# Altium project AthletiTech_V1.0.PrjPcb (part 4 of 4)

## Sheet GPS_Sheet.SchDoc
size 420 x 297 mm; SheetNumber: 5; SheetTotal: 5
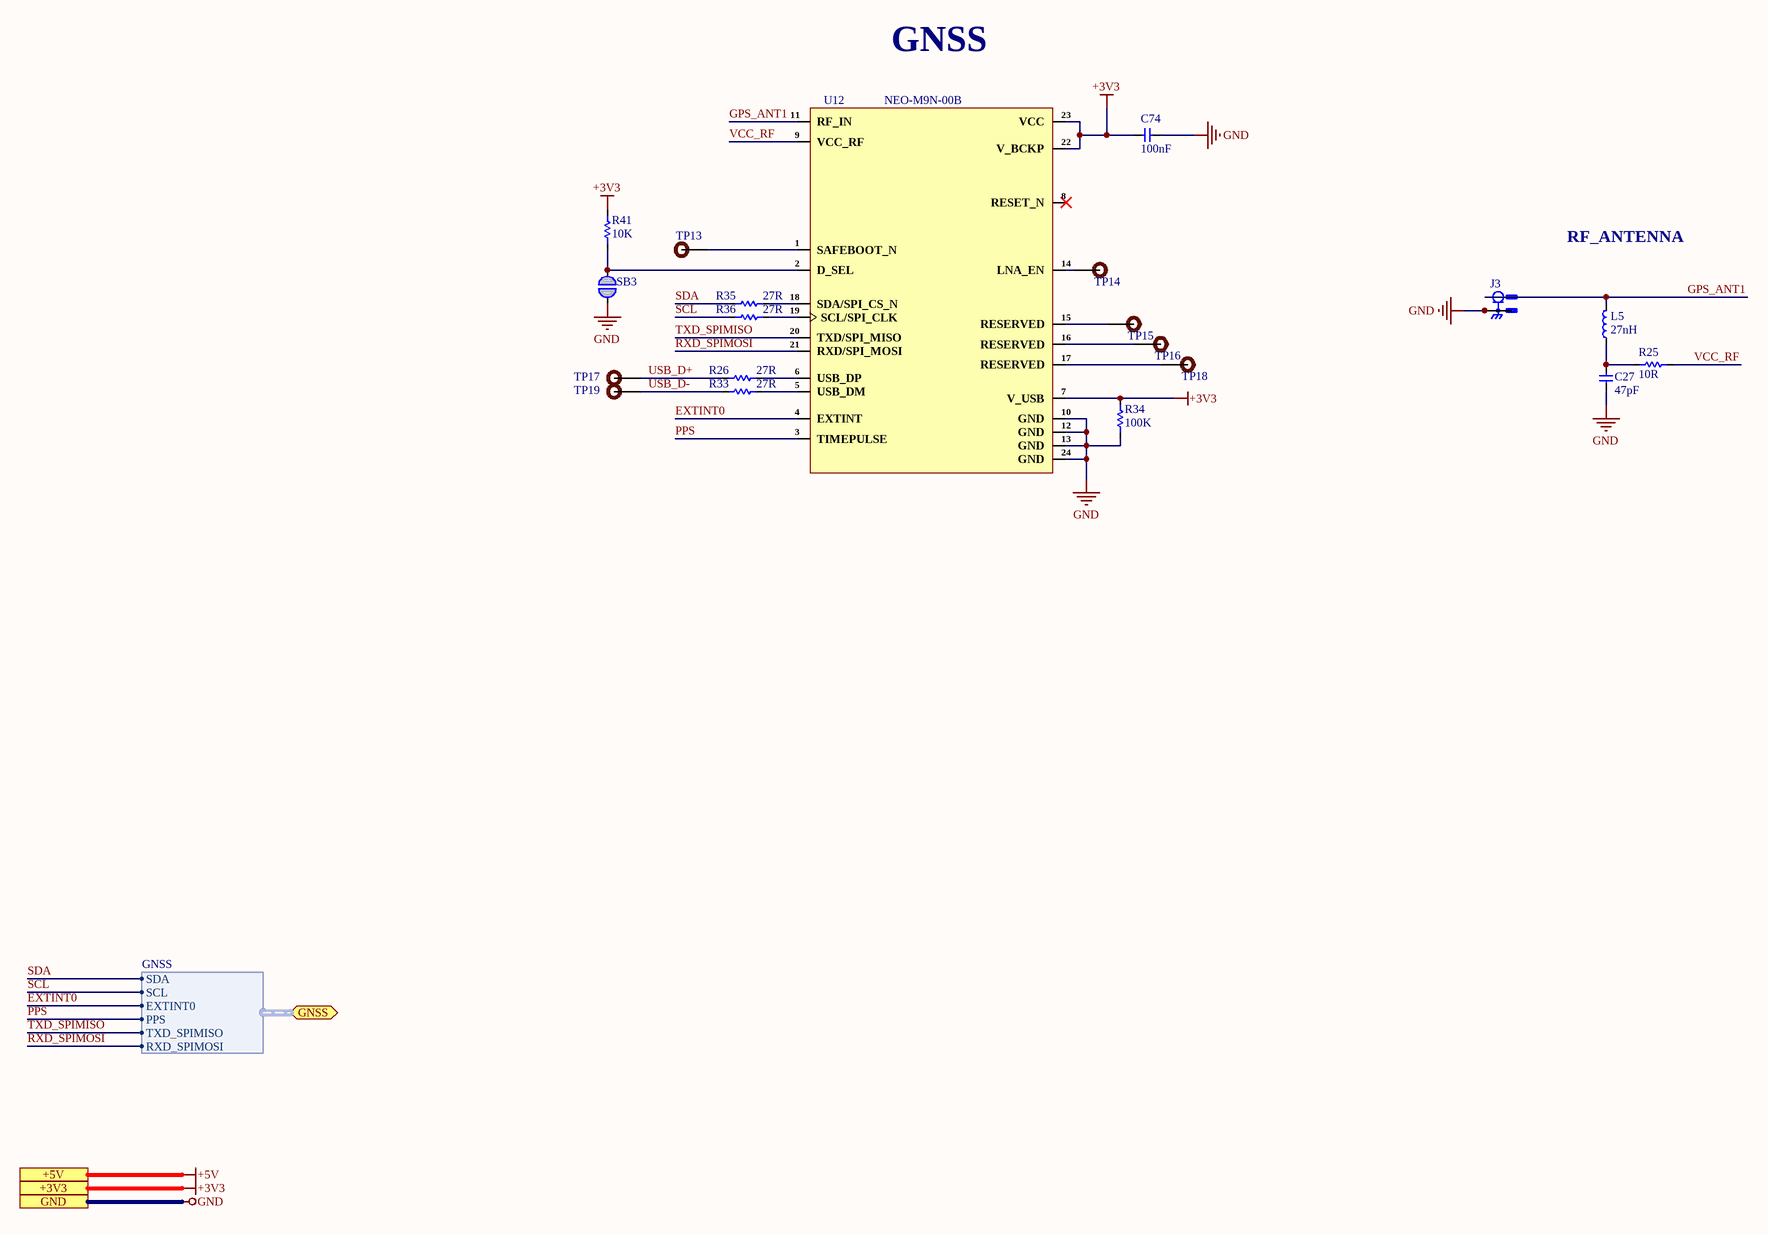
[diagram p4: GPS_Sheet.SchDoc]

### Parts
C27  47pF  [Cap-0603]
C74  100nF  [cap-0402]
J3  CONMHF4-SMD-G-T  [CONMHF4-SMD-G-T]  (value not drawn)
L5  27nH  [IND-0402]
R25  10R  [Res-0603]
R26  27R  [Res-0402]
R33  27R  [Res-0402]
R34  100K  [Res-0603]
R35  27R  [Res-0402]
R36  27R  [Res-0402]
R41  10K  [Res-0603]
SB3  Solder Bridge 0603  [Solder Bridge]  (value not drawn)  (no BOM)
TP13  TEST POINT 0.5mm Dia  [Test-point - 0.5mm]  (value not drawn)  (no BOM)
TP14  TEST POINT 0.5mm Dia  [Test-point - 0.5mm]  (value not drawn)  (no BOM)
TP15  TEST POINT 0.5mm Dia  [Test-point - 0.5mm]  (value not drawn)  (no BOM)
TP16  TEST POINT 0.5mm Dia  [Test-point - 0.5mm]  (value not drawn)  (no BOM)
TP17  TEST POINT 0.5mm Dia  [Test-point - 0.5mm]  (value not drawn)  (no BOM)
TP18  TEST POINT 0.5mm Dia  [Test-point - 0.5mm]  (value not drawn)  (no BOM)
TP19  TEST POINT 0.5mm Dia  [Test-point - 0.5mm]  (value not drawn)  (no BOM)
U12  NEO-M9N-00B  [NEO-M9N-00B]

### Ports
+3V3, +5V, GND, GNSS (bidir, harness GNSS)

### Harnesses
GNSS: SDA, SCL, EXTINT0, PPS, TXD_SPIMISO, RXD_SPIMOSI

### Nets
+3V3: C74.2 R34.2 R41.2 U12.7(V_USB) U12.22(V_BCKP) U12.23(VCC) ; port +3V3  [project net VDDAON]
GND: C27.1 C74.1 J3.S1 J3.S2 J3.S3 R34.1 SB3.2 U12.10(GND) U12.12(GND) U12.13(GND) U12.24(GND) ; port GND
EXTINT0: U12.4(EXTINT) ; port GNSS.EXTINT0
GPS_ANT1: J3.1 L5.2 U12.11(RF_IN)
PPS: U12.3(TIMEPULSE) ; port GNSS.PPS
RXD_SPIMOSI: U12.21(RXD/SPI_MOSI) ; port GNSS.RXD_SPIMOSI
SCL: R36.1 ; port GNSS.SCL
SDA: R35.1 ; port GNSS.SDA
TXD_SPIMISO: U12.20(TXD/SPI_MISO) ; port GNSS.TXD_SPIMISO
USB_D+: R26.1 TP17.1
USB_D-: R33.1 TP19.1
VCC_RF: R25.2 U12.9(VCC_RF)
NetC27_2: C27.2 L5.1 R25.1
NetR26_2: R26.2 U12.6(USB_DP)
NetR33_2: R33.2 U12.5(USB_DM)
NetR35_2: R35.2 U12.18(SDA/SPI_CS_N)
NetR36_2: R36.2 U12.19(SCL/SPI_CLK)
NetR41_1: R41.1 SB3.1 U12.2(D_SEL)
NetTP13_1: TP13.1 U12.1(SAFEBOOT_N)
NetTP14_1: TP14.1 U12.14(LNA_EN)
NetTP15_1: TP15.1 U12.15(RESERVED)
NetTP16_1: TP16.1 U12.16(RESERVED)
NetTP18_1: TP18.1 U12.17(RESERVED)

Not connected (* = marked no-connect by the designer): U12 8(RESET_N)*

### Notes on the sheet
- GNSS
- RF_ANTENNA
- File:
- Title:
- Date:
- Page
- Num:
- Total:
- Drawn By: Huzaifa Ali

### Library data of the parts
C27 = CC0603FRNPO9BN470: CAP CER 47PF 50V NPO 0603; Manufacturer: Yageo; Item Type: Capacitor; Supplier: Digikey; LCSC Part Number: C519486; Manufacturer Part Number: CC0603FRNPO9BN470; RoHS: Yes; Stock: 37282; Pricing: 1=0.19, 10=0.126, 50=0.0756, 100=0.0594, 500=0.0439, 1000=0.03634 (USD); ComponentLink1URL: https://datasheet.ciiva.com/5425/upy-gp-np0-16v-to-50v-8-5425545.pdf?src-supplier=Mouser; ComponentLink1Description: https://datasheet.ciiva.com/5425/upy-gp-np0-16v-to-50v-8-5425545.pdf?src-supplier=Mouser; ComponentLink2URL: https://datasheet.ciiva.com/11586/upy-gp-np0-16v-to-50v-8-11586472.pdf?src-supplier=Avnet; ComponentLink2Description: https://datasheet.ciiva.com/11586/upy-gp-np0-16v-to-50v-8-11586472.pdf?src-supplier=Avnet
C74 = C1005X7R1H104KT000F: CAP CER 0.1UF 50V X7R 0402; Manufacturer: TDK; Tolerance: 10%; Voltage: 25V; Item Type: Capacitor; Supplier 1: Avnet; Manufacturer Part Number: C1005X7R1H104KT000F; RoHS: No; Category: Ceramic Capacitors; Dielectric: X7R; Supplier Part Number 1: C1005X7R1H104KT000F; LCSC Part Number: C361198; ComponentLink1Description: LCSC; ComponentLink1URL: https://www.lcsc.com/product-detail/Multilayer-Ceramic-Capacitors-MLCC-SMD-SMT_TDK-C1005X7R1H104KT000F_C361198.html
J3 = CONMHF4-SMD-G-T: CONN MHF4 JACK STR SMD; Manufacturer: TE Connectivity; Item Type: Connectors; Number of Positions: 1; Supplier: Mouser; Supplier Part Number: 712-CONMHF4-SMD-G-T; Manufacturer Part Number: CONMHF4-SMD-G-T; RoHS: No; Stock: 14009; Pricing: 1=0.35, 10=0.35, 50=0.35, 100=0.345, 1000=0.26, 10000=0.26 (USD)
L5 = LQG15HZ27NH02D: FIXED IND 27NH 350MA 460MOHM SMD; Manufacturer: Murata; Core Material: Air; Tolerance: 3%; Shielding: Unshielded; DC Resistance (DCR): 460mR; Self Resonant Frequency: 1.7GHz; Test Frequency: 100MHz; Item Type: Inductor; Supplier: Mouser; Supplier Part Number: 81-LQG15HZ27NH02D; Manufacturer Part Number: LQG15HZ27NH02D; RoHS: Yes; Category: Fixed Inductors; Stock: 436; Pricing: 1=0.1, 10=0.068, 50=0.068, 100=0.047, 1000=0.03, 10000=0.026 (USD); Mounting Technology: Surface Mount; Case/Package: 0402; Case Code (Imperial): 0402; Case Code (Metric): 1005; Min Operating Temperature: -55°C; Max Operating Temperature: 125°C; Packaging: Cut Tape; Value: 27nH; Current Rating: 350mA; Series: LQG15; Ratings: AEC-Q200; RoHS Compliant: Yes; ComponentLink1URL: http://search.murata.co.jp/Ceramy/image/img/P02/JELF243B-9110.pdf?src-supplier=Digi-Key; ComponentLink1Description: http://search.murata.co.jp/Ceramy/image/img/P02/JELF243B-9110.pdf?src-supplier=Digi-Key; LCSC Part Number: C237452
R25 = RC0603FR-0710RL: RES SMD 10 OHM 1% 1/10W 0603; Manufacturer: Yageo; Temperature Coefficient: 200ppm/°C; Power Rating: 100mW; Voltage Rating: 50V; Item type: Resistor; Supplier 1: Digi-Key; Manufacturer Part Number: RC0603FR-0710RL; Stock 1: 10836596; Pricing 1: 1=0.1, 10=0.046, 100=0.0187, 1000=0.0084, 2500=0.00729 (USD); Case/Package: 0603; Number of Pins: 2; Case Code (Imperial): 0603; Case Code (Metric): 1608; Contact Plating: Tin,Matte; Min Operating Temperature: -55°C; Max Operating Temperature: 155°C; Resistance: 10R; Tolerance: 1%; Composition: Thick Film; Packaging: Tape and Reel; Voltage Rating (DC): 50V; Termination: SMD/SMT; Military Standard: Not; Length: 1.6mm; Height: 0.45mm; Width: 0.8mm; Depth: 0.8mm; Radiation Hardening: No; Lead Free: Lead Free; REACH SVHC: No SVHC; ComponentLink1URL: http://www.farnell.com/datasheets/1868787.pdf?src-supplier=Element14; ComponentLink1Description: http://www.farnell.com/datasheets/1868787.pdf?src-supplier=Element14; ComponentLink2URL: http://www.yageo.com/documents/recent/PYu-RC0603_51_RoHS_L_4.pdf?src-supplier=Avnet; ComponentLink2Description: http://www.yageo.com/documents/recent/PYu-RC0603_51_RoHS_L_4.pdf?src-supplier=Avnet; ComponentLink3URL: http://documents.rs-components.com/techlib://itc_doclist_GB.htm?stockno=5048984&src-supplier=RSComponents; ComponentLink3Description: http://documents.rs-components.com/techlib://itc_doclist_GB.htm?stockno=5048984&src-supplier=RSComponents; ComponentLink4URL: http://www.yageo.com/documents/recent/PYu-RC0603_51_RoHS_L_4.pdf?src-supplier=Avnet+Europe; ComponentLink4Description: http://www.yageo.com/documents/recent/PYu-RC0603_51_RoHS_L_4.pdf?src-supplier=Avnet+Europe; Supplier Part Number 1: 311-10.0HRDKR-ND; LCSC Part Number: C109318
R26 R33 R35 R36 = CRGCQ0402F27R: SMD Chip Resistor, 27 Ohm, ± 1%, 63 mW, 0402 [1005 Metric], Thick Film, General Purpose; Manufacturer: TE Connectivity; Operating Supply Voltage: 50V; Power Rating: 62.5mW; Supplier: Digikey; Supplier Part Number: A129608CT-ND; Manufacturer Part Number: CRGCQ0402F27R; RoHS: Yes; Category: Chip SMD Resistors; Stock: 81404; Pricing: 1=0.1, 10=0.02, 50=0.0126, 100=0.0105, 500=0.00708, 1000=0.00609, 5000=0.00442 (USD); Voltage Rating: 50V; Voltage Rating (DC): 50V; Height: 400um; ComponentLink1URL: http://datasheet.octopart.com/CRGCQ0402F27R-TE-Connectivity-datasheet-114679081.pdf?src-supplier=Farnell; ComponentLink1Description: http://datasheet.octopart.com/CRGCQ0402F27R-TE-Connectivity-datasheet-114679081.pdf?src-supplier=Farnell; ComponentLink2URL: http://datasheet.octopart.com/CRGCQ0402F27R-TE-Connectivity-datasheet-114679081.pdf?src-supplier=Mouser; ComponentLink2Description: http://datasheet.octopart.com/CRGCQ0402F27R-TE-Connectivity-datasheet-114679081.pdf?src-supplier=Mouser; ComponentLink3URL: http://datasheet.octopart.com/CRGCQ0402F27R-TE-Connectivity-datasheet-114679081.pdf?src-supplier=Avnet; ComponentLink3Description: http://datasheet.octopart.com/CRGCQ0402F27R-TE-Connectivity-datasheet-114679081.pdf?src-supplier=Avnet; ComponentLink4URL: https://www.te.com/commerce/DocumentDelivery/DDEController?Action=srchrtrv&amp;DocNm=1773204-3&amp;DocType=DS&amp;DocLang=English&src-supplier=Digikey; ComponentLink4Description: https://www.te.com/commerce/DocumentDelivery/DDEController?Action=srchrtrv&amp;DocNm=1773204-3&amp;DocType=DS&amp;DocLang=English&src-supplier=Digikey; ComponentLink5URL: http://datasheet.octopart.com/CRGCQ0402F27R-TE-Connectivity-datasheet-114679081.pdf?src-supplier=Digikey; ComponentLink5Description: http://datasheet.octopart.com/CRGCQ0402F27R-TE-Connectivity-datasheet-114679081.pdf?src-supplier=Digikey; ComponentLink6URL: http://datasheet.octopart.com/CRGCQ0402F27R-TE-Connectivity-datasheet-114679081.pdf?src-supplier=Newark; ComponentLink6Description: http://datasheet.octopart.com/CRGCQ0402F27R-TE-Connectivity-datasheet-114679081.pdf?src-supplier=Newark; ComponentLink7URL: http://datasheet.octopart.com/CRGCQ0402F27R-TE-Connectivity-datasheet-114679081.pdf?src-supplier=Verical; ComponentLink7Description: http://datasheet.octopart.com/CRGCQ0402F27R-TE-Connectivity-datasheet-114679081.pdf?src-supplier=Verical; ComponentLink8URL: http://datasheet.octopart.com/CRGCQ0402F27R-TE-Connectivity-datasheet-114679081.pdf?src-supplier=Arrow+Electronics; ComponentLink8Description: http://datasheet.octopart.com/CRGCQ0402F27R-TE-Connectivity-datasheet-114679081.pdf?src-supplier=Arrow+Electronics; ComponentLink9URL: http://datasheet.octopart.com/CRGCQ0402F27R-TE-Connectivity-datasheet-114679081.pdf?src-supplier=Onlinecomponents.com; ComponentLink9Description: http://datasheet.octopart.com/CRGCQ0402F27R-TE-Connectivity-datasheet-114679081.pdf?src-supplier=Onlinecomponents.com; ComponentLink10URL: http://datasheet.octopart.com/CRGCQ0402F27R-TE-Connectivity-datasheet-114679081.pdf?src-supplier=Sager+Electronics; ComponentLink10Description: http://datasheet.octopart.com/CRGCQ0402F27R-TE-Connectivity-datasheet-114679081.pdf?src-supplier=Sager+Electronics; ComponentLink11URL: http://datasheet.octopart.com/CRGCQ0402F27R-TE-Connectivity-datasheet-114679081.pdf?src-supplier=Electro+Sonic; ComponentLink11Description: http://datasheet.octopart.com/CRGCQ0402F27R-TE-Connectivity-datasheet-114679081.pdf?src-supplier=Electro+Sonic; ComponentLink12URL: http://datasheet.octopart.com/CRGCQ0402F27R-TE-Connectivity-datasheet-114679081.pdf?src-supplier=Heilind+Electronics; ComponentLink12Description: http://datasheet.octopart.com/CRGCQ0402F27R-TE-Connectivity-datasheet-114679081.pdf?src-supplier=Heilind+Electronics; ComponentLink13URL: http://datasheet.octopart.com/CRGCQ0402F27R-TE-Connectivity-datasheet-114679081.pdf?src-supplier=Interstate+Connecting+Components; ComponentLink13Description: http://datasheet.octopart.com/CRGCQ0402F27R-TE-Connectivity-datasheet-114679081.pdf?src-supplier=Interstate+Connecting+Components; ComponentLink14URL: https://datasheet.octopart.com/CRGCQ0402F27R-TE-Connectivity-datasheet-114679081.pdf?src-supplier=Master+Electronics; ComponentLink14Description: https://datasheet.octopart.com/CRGCQ0402F27R-TE-Connectivity-datasheet-114679081.pdf?src-supplier=Master+Electronics; ComponentLink15URL: http://datasheet.octopart.com/CRGCQ0402F27R-TE-Connectivity-datasheet-114679081.pdf?src-supplier=TME; ComponentLink15Description: http://datasheet.octopart.com/CRGCQ0402F27R-TE-Connectivity-datasheet-114679081.pdf?src-supplier=TME
R34 = CRCW0603100KFKEA: RES SMD 100K OHM 1% 1/10W 0603; Item Type: Resistor; Value: 100kR; Temperature Coefficient: 100ppm/°C; Voltage Rating: 75V; Power Rating: 100mW; ComponentLink1Description: LCSC; Supplier: Mouser; Supplier Part Number: 71-CRCW0603-100K-E3; RoHS: Yes; Category: Chip SMD Resistors; Stock: 716604; Pricing: 1=0.1, 10=0.019, 50=0.019, 100=0.009, 1000=0.007, 10000=0.004 (USD); Case/Package: 345Case; Pins: 2NUMBER; Case Code (Imperial): 0603; Case Code (Metric): 1608; Min Operating Temperature: -55°C; Max Operating Temperature: 155°C; Tolerance: 1%; Resistor Type: Thick Film; Resistance Tolerance: 1%; Packaging: 13Packaging; Voltage Rating (DC): 75V; Features: 6309FeaturesType; Height: 500um; RoHS Compliant: Yes; Lead Free: 5697LeadFree; ComponentLink2URL: http://www.farnell.com/datasheets/2310790.pdf?src-supplier=Farnell; ComponentLink2Description: http://www.farnell.com/datasheets/2310790.pdf?src-supplier=Farnell; ComponentLink3URL: https://datasheet.octopart.com/CRCW0603100KFKEA-Vishay-datasheet-14722531.pdf?src-supplier=Newark; ComponentLink3Description: https://datasheet.octopart.com/CRCW0603100KFKEA-Vishay-datasheet-14722531.pdf?src-supplier=Newark; ComponentLink4URL: https://www.vishay.com/docs/20035/dcrcwe3.pdf?src-supplier=Digi-Key; ComponentLink4Description: https://www.vishay.com/docs/20035/dcrcwe3.pdf?src-supplier=Digi-Key; ComponentLink5URL: https://datasheet.octopart.com/CRCW0603100KFKEA-Vishay-datasheet-5300368.pdf?src-supplier=Future+Electronics; ComponentLink5Description: https://datasheet.octopart.com/CRCW0603100KFKEA-Vishay-datasheet-5300368.pdf?src-supplier=Future+Electronics; ComponentLink6URL: http://www.farnell.com/datasheets/2310790.pdf?src-supplier=Newark; ComponentLink6Description: http://www.farnell.com/datasheets/2310790.pdf?src-supplier=Newark; ComponentLink7URL: http://www.farnell.com/datasheets/2310790.pdf?src-supplier=Element14; ComponentLink7Description: http://www.farnell.com/datasheets/2310790.pdf?src-supplier=Element14; ComponentLink8URL: https://datasheet.octopart.com/CRCW0603100KFKEA-Vishay-datasheet-83961561.pdf?src-supplier=Element14; ComponentLink8Description: https://datasheet.octopart.com/CRCW0603100KFKEA-Vishay-datasheet-83961561.pdf?src-supplier=Element14; ComponentLink9URL: https://datasheet.octopart.com/CRCW0603100KFKEA-Vishay-datasheet-8363642.pdf?src-supplier=Verical; ComponentLink9Description: https://datasheet.octopart.com/CRCW0603100KFKEA-Vishay-datasheet-8363642.pdf?src-supplier=Verical; ComponentLink10URL: https://datasheet.octopart.com/CRCW0603100KFKEA-Vishay-datasheet-508714.pdf?src-supplier=Farnell; ComponentLink10Description: https://datasheet.octopart.com/CRCW0603100KFKEA-Vishay-datasheet-508714.pdf?src-supplier=Farnell; ComponentLink11URL: https://datasheet.octopart.com/CRCW0603100KFKEA-Vishay-datasheet-17834126.pdf?src-supplier=TME; ComponentLink11Description: https://datasheet.octopart.com/CRCW0603100KFKEA-Vishay-datasheet-17834126.pdf?src-supplier=TME; LCSC Part Number: C844916
R41 = ESR03EZPJ103: RES SMD 10K OHM 5% 1/4W 0603; Manufacturer: ROHM Semicon; Item Type: Resistor; Manufacturer Part Number: ESR03EZPJ103; Value: 10K; Package: 0603; ComponentLink1Description: LCSC; ComponentLink1URL: https://www.lcsc.com/product-detail/Chip-Resistor-Surface-Mount_ROHM-Semicon-ESR03EZPJ103_C253330.html; LCSC Part Number: C253330
SB3 = Solder Bridge 0603: Solder Bridge ON; Manufacturer Part Number: Solder Bridge; Item Type: Solder Bridge
TP13-TP19 = TEST POINT 0.5mm Dia: Test Point ON; Item Type: Test Point; Manufacturer Part Number: TEST POINT 0.5mm Dia
U12 = NEO-M9N-00B: M9 STANDARD PRECISION GNSS MOD; Manufacturer: u-blox; Item Type: Module; Supplier: Avnet; Supplier Part Number: NEO-M9N-00B; Manufacturer Part Number: NEO-M9N-00B; RoHS: Yes; Stock: 250; Pricing: 250=15.92583, 500=15.54578, 1000=15.17333, 1500=14.79716, 2000=14.42092 (USD)

## Nets that join several sheets
+5V: Power_Sheet (5 pins), MCU_Sheet (C22.1 U5.AD2)
GND: Power_Sheet (33 pins), MCU_Sheet (43 pins), UWB_Sheet (35 pins), IMU_Sheet (16 pins), GPS_Sheet (11 pins)
VBATT: Power_Sheet (7 pins), MCU_Sheet (R11.2)
VBATT/5V: Power_Sheet (11 pins), MCU_Sheet (C11.2 C12.2 R9.2 U3.5)
VDDAON: Power_Sheet (9 pins), MCU_Sheet (15 pins), UWB_Sheet (21 pins), IMU_Sheet (28 pins), GPS_Sheet (6 pins)
BAT STATUS READ: Power_Sheet (R1.1 U1.7), MCU_Sheet (U5.H2)
BAT_nRF: Power_Sheet (R4.1 U1.9), MCU_Sheet (U5.V23)
EXTINT0: MCU_Sheet (U5.AC11), GPS_Sheet (U12.4)
EXTON: MCU_Sheet (U5.AC19), UWB_Sheet (U11.21)
GPIO0: MCU_Sheet (U5.B19), UWB_Sheet (U11.38)
GPIO1: MCU_Sheet (U5.A16), UWB_Sheet (U11.37)
GPIO2: MCU_Sheet (U5.AD10), UWB_Sheet (U11.36)
GPIO3: MCU_Sheet (U5.AD8), UWB_Sheet (U11.35)
GPIO4: MCU_Sheet (U5.Y23), UWB_Sheet (U11.34)
GPIO5: MCU_Sheet (U5.U24), UWB_Sheet (R22.2 U11.33)
GPIO6: MCU_Sheet (U5.P2), UWB_Sheet (R23.1 U11.30)
INT2: MCU_Sheet (U5.A12), IMU_Sheet (U8.4)
INT3: MCU_Sheet (U5.N1), IMU_Sheet (U10.4)
INT4: MCU_Sheet (U5.AD18), IMU_Sheet (U9.4)
INTB: MCU_Sheet (R13.1 U4.A1 U5.AC21), IMU_Sheet (U7.4)
IRQ: MCU_Sheet (U5.P23), UWB_Sheet (R19.1 U11.45)
MCU_3V3_EN: Power_Sheet (D1.2), MCU_Sheet (U5.A10)
PPS: MCU_Sheet (U5.B13), GPS_Sheet (U12.3)
PWR_SW_SENSE: Power_Sheet (D7.2 R7.1 R31.2), MCU_Sheet (U5.AC15)
RSTn: MCU_Sheet (U5.T23), UWB_Sheet (U11.27)
RXD_SPIMOSI: MCU_Sheet (U5.R24), GPS_Sheet (U12.21)
SCL: MCU_Sheet (R15.1 U4.B2 U5.B15), IMU_Sheet (U7.13 U8.13), GPS_Sheet (R36.1)
SCL2: MCU_Sheet (U5.D2), IMU_Sheet (U9.13 U10.13)
SDA: MCU_Sheet (R14.1 U4.A3 U5.A20), IMU_Sheet (U7.14 U8.14), GPS_Sheet (R35.1)
SDA2: MCU_Sheet (U5.F2), IMU_Sheet (U9.14 U10.14)
SPICLK: MCU_Sheet (U5.AC9), UWB_Sheet (U11.41)
SPICSN: MCU_Sheet (U5.AC17), UWB_Sheet (U11.24)
SPIMISO: MCU_Sheet (U5.AD12), UWB_Sheet (U11.40)
SPIMOSI: MCU_Sheet (U5.AD16), UWB_Sheet (U11.39)
SYNC: MCU_Sheet (U5.W24), UWB_Sheet (U11.29)
TXD_SPIMISO: MCU_Sheet (U5.J24), GPS_Sheet (U12.20)
WAKEUP: MCU_Sheet (U5.AD20), UWB_Sheet (U11.23)